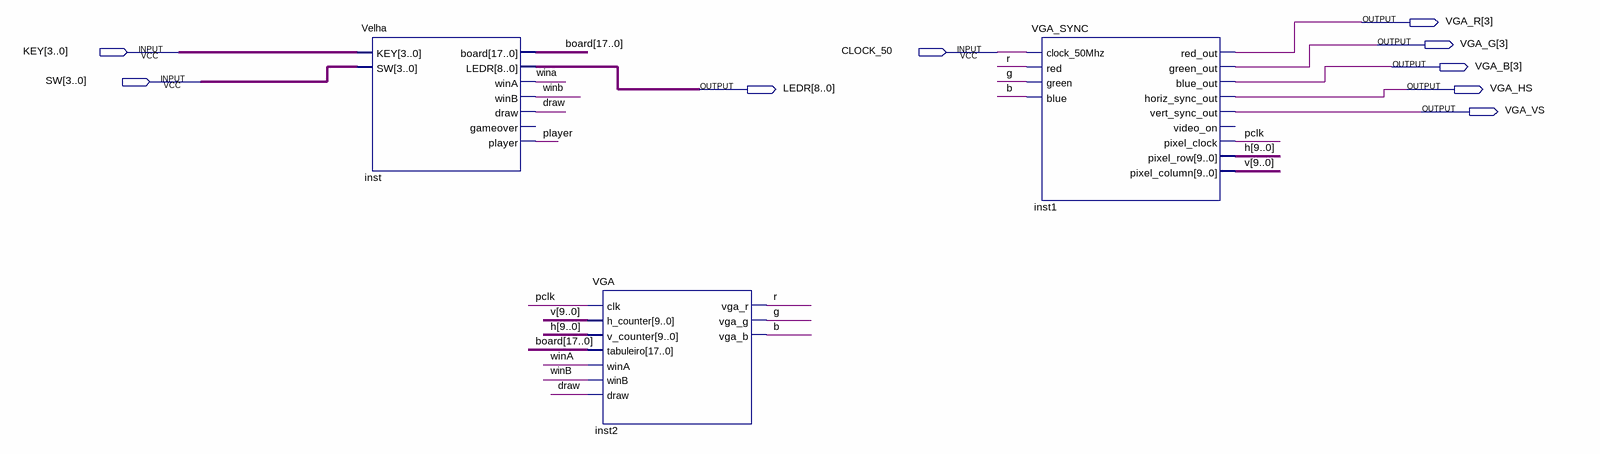
[diagram p0: schematic sheet]
// Quartus schematic Block2.bdf as structural Verilog: 3 symbols, 9 pins
module Block2 (
  input  [3:0] KEY,
  input  CLOCK_50,
  input  [3:0] SW,
  output [3:3] VGA_R,
  output [3:3] VGA_G,
  output [3:3] VGA_B,
  output [8:0] LEDR,
  output VGA_HS,
  output VGA_VS
);

  wire b, draw, g, pclk, player, r, wina, winb;
  wire [9:0] h, v;
  wire [17:0] board;

  Velha inst (
    .KEY(KEY), .SW(SW), .board(board), .LEDR(LEDR), .winA(wina), .winB(winb), .draw(draw), .player(player));  // open: gameover
  VGA inst2 (
    .clk(pclk), .h_counter(v), .v_counter(h), .tabuleiro(board), .winA(wina), .winB(winb), .draw(draw),
    .vga_r(r), .vga_g(g), .vga_b(b));
  VGA_SYNC inst1 (
    .clock_50Mhz(CLOCK_50), .red(r), .green(g), .blue(b), .red_out(VGA_R[3]), .green_out(VGA_G[3]),
    .blue_out(VGA_B[3]), .horiz_sync_out(VGA_HS), .vert_sync_out(VGA_VS), .pixel_clock(pclk), .pixel_row(h),
    .pixel_column(v));  // open: video_on
endmodule
